# Altium project Main_Board.PrjPcb (part 41 of 44)

## Sheet eMMC.SchDoc: Pamięć nieulotna  eMMC
size A3; Organization: Altium Limited; Address1: L3, 12a Rodborough Rd; Address2: Frenchs Forest; Address3: NSW; Address4: Australia 2086
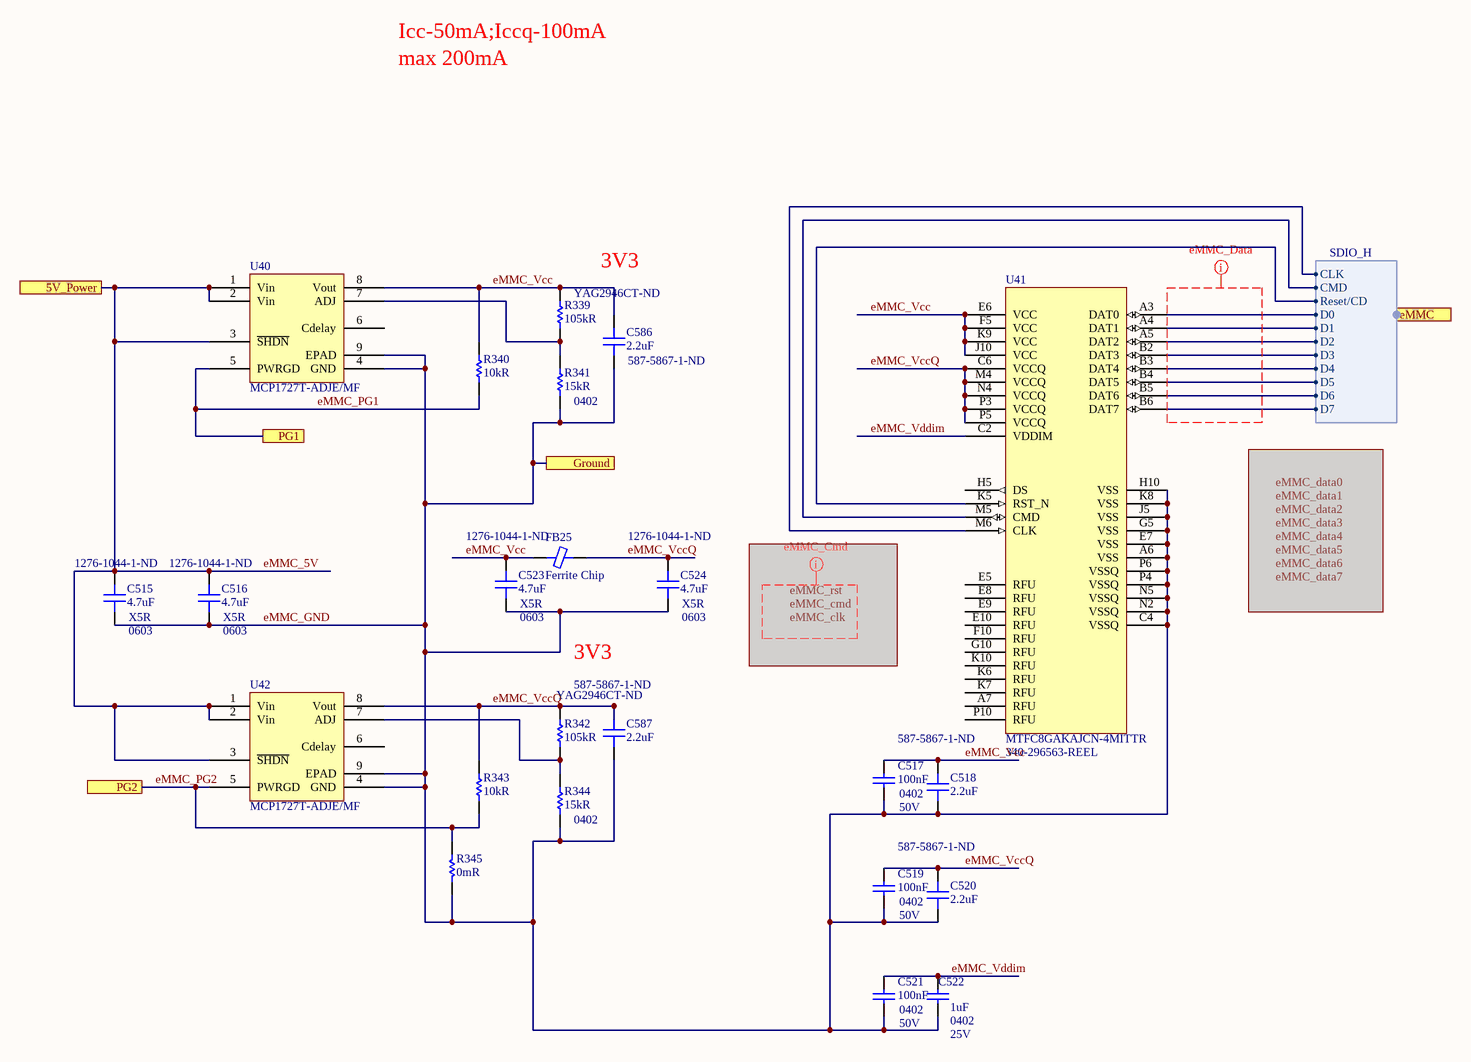
[diagram p66: eMMC.SchDoc]

### Parts
C515  4.7uF  Supplier Part Number 1: 1276-1044-1-ND  Case/Package: 0603  Dielectric: X5R  [CAP 0603/1608 RF]
C516  4.7uF  Supplier Part Number 1: 1276-1044-1-ND  Case/Package: 0603  Dielectric: X5R  [CAP 0603/1608 RF]
C517  100nF  Case Code (Imperial): 0402  Voltage: 50V  [CAP 0402/1005 KK]
C518  2.2uF  Supplier Part Number 1: 587-5867-1-ND  [CAP 0402/1005 KK]
C519  100nF  Case Code (Imperial): 0402  Voltage: 50V  [CAP 0402/1005 KK]
C520  2.2uF  Supplier Part Number 1: 587-5867-1-ND  [CAP 0402/1005 KK]
C521  100nF  Case Code (Imperial): 0402  Voltage: 50V  [CAP 0402/1005 KK]
C522  1uF  Case/Package: 0402  Voltage Rating: 25V  [CAP 0402/1005 KK]
C523  4.7uF  Supplier Part Number 1: 1276-1044-1-ND  Case/Package: 0603  Dielectric: X5R  [CAP 0603/1608 RF]
C524  4.7uF  Supplier Part Number 1: 1276-1044-1-ND  Case/Package: 0603  Dielectric: X5R  [CAP 0603/1608 RF]
C586  2.2uF  Supplier Part Number 1: 587-5867-1-ND  [CAP 0402/1005 KK]
C587  2.2uF  Supplier Part Number 1: 587-5867-1-ND  [CAP 0402/1005 KK]
FB25  Ferrite Chip  [FER 0603/1608]
R339  105kR  Supplier Part Number 1: YAG2946CT-ND  [RES 0402/1005 RF KK]
R340  10kR  [RES 0402/1005 RF KK]
R341  15kR  Case Code (Imperial): 0402  [RES 0402/1005 RF KK]
R342  105kR  Supplier Part Number 1: YAG2946CT-ND  [RES 0402/1005 RF KK]
R343  10kR  [RES 0402/1005 RF KK]
R344  15kR  Case Code (Imperial): 0402  [RES 0402/1005 RF KK]
R345  0mR  [RES 0402/1005 RF KK]
U40  MCP1727T-ADJE/MF  [MCP1727T-ADJE/MF]
U41  MTFC8GAKAJCN-4MITTR  Supplier Part Number 1: 340-296563-REEL  [MTFC8GAKAJCN-4M IT TR]
U42  MCP1727T-ADJE/MF  [MCP1727T-ADJE/MF]

### Ports
5V_Power, eMMC (harness SDIO_H), Ground, PG1, PG2

### Harnesses
SDIO_H: CLK, CMD, Reset/CD, D0, D1, D2, D3, D4, D5, D6, D7

### Nets
eMMC_GND: C515.1 C516.1 C517.1 C518.1 C519.1 C520.1 C521.1 C522.2 C523.1 C524.1 C586.1 C587.1 R341.1 R344.1 R345.2 U40.4(GND) U40.9(EPAD) U41.A6(VSS) U41.C4(VSSQ) U41.E7(VSS) U41.G5(VSS) U41.H10(VSS) U41.J5(VSS) U41.K8(VSS) U41.N2(VSSQ) U41.N5(VSSQ) U41.P4(VSSQ) U41.P6(VSSQ) U42.4(GND) U42.9(EPAD) ; port Ground  [project net B503_Ground]
eMMC_5V: C515.2 C516.2 U40.1(Vin) U40.2(Vin) U40.3(~{SHDN}) U42.1(Vin) U42.2(Vin) U42.3(~{SHDN}) ; port 5V_Power  [project net 5V_RAIL]
eMMC_clk: U41.M6(CLK) ; port eMMC.CLK
eMMC_cmd: U41.M5(CMD) ; port eMMC.CMD
eMMC_data0: U41.A3(DAT0) ; port eMMC.D0
eMMC_data1: U41.A4(DAT1) ; port eMMC.D1
eMMC_data2: U41.A5(DAT2) ; port eMMC.D2
eMMC_data3: U41.B2(DAT3) ; port eMMC.D3
eMMC_data4: U41.B3(DAT4) ; port eMMC.D4
eMMC_data5: U41.B4(DAT5) ; port eMMC.D5
eMMC_data6: U41.B5(DAT6) ; port eMMC.D6
eMMC_data7: U41.B6(DAT7) ; port eMMC.D7
eMMC_PG1: R340.1 U40.5(PWRGD) ; port PG1
eMMC_PG2: R343.1 R345.1 U42.5(PWRGD) ; port PG2
eMMC_rst: U41.K5(RST_N) ; port eMMC.Reset/CD
eMMC_Vcc: C517.2 C518.2 C523.2 C586.2 FB25.1 R339.2 R340.2 U40.8(Vout) U41.E6(VCC) U41.F5(VCC) U41.J10(VCC) U41.K9(VCC)
eMMC_VccQ: C519.2 C520.2 C524.2 C587.2 FB25.2 R342.2 R343.2 U41.C6(VCCQ) U41.M4(VCCQ) U41.N4(VCCQ) U41.P3(VCCQ) U41.P5(VCCQ) U42.8(Vout)
eMMC_Vddim: C521.2 C522.1 U41.C2(VDDIM)
NetR339_1: R339.1 R341.2 U40.7(ADJ)
NetR342_1: R342.1 R344.2 U42.7(ADJ)

Not connected (* = marked no-connect by the designer): U40 6(Cdelay); U41 A7(RFU) E5(RFU) E8(RFU) E9(RFU) E10(RFU) F10(RFU) G10(RFU) H5(DS) K6(RFU) K7(RFU) K10(RFU) P10(RFU); U42 6(Cdelay)

### Layout directives
net class eMMC_Data: (no net found under the mark)
net class eMMC_Cmd: eMMC_clk, eMMC_cmd, eMMC_rst

### Notes on the sheet
- Icc-50mA;Iccq-100mA
- max 200mA
- 3V3
- Title
- Size:
- Date:
- A3
- Number:
- Time:
- Revision:
- Sheet
- of
- File:

### Library data of the parts
C515 C516 C523 C524 = Capacitor: Manufacturer: Samsung; Manufacturer Part Number: CL10A475KP8NNNC; Tolerance: 10%; Voltage Rating: 10V; Supplier 1: Digi-Key; Stock 1: 2124648; Pricing 1: 1 = 0,13000, 10 = 0,09600, 100 = 0,04520, 500 = 0,03168, 1000 = 0,02622 (USD); RoHS: Yes; Mount: Surface Mount; Case Code (Metric): 1608; Case Code (Imperial): 0603; Contact Plating: Tin; Min Operating Temperature: -55°C; Max Operating Temperature: 85°C; Capacitance: 4.7uF; Package Quantity: 1; Packaging: Tape and Reel; Length: 1.6mm; Height: 0.8mm; Width: 0.031inch; Thickness: 0.035inch; Depth: 0.8mm; Radiation Hardening: No; ComponentLink1URL: https://datasheet.ciiva.com/25797/cl10a475kp8nnnc-25797520.pdf?src-supplier=Digi-Key; ComponentLink1Description: https://datasheet.ciiva.com/25797/cl10a475kp8nnnc-25797520.pdf?src-supplier=Digi-Key; ComponentLink2URL: https://datasheet.ciiva.com/26838/getdatasheetpartid-358676-26838384.pdf?src-supplier=Verical; ComponentLink2Description: https://datasheet.ciiva.com/26838/getdatasheetpartid-358676-26838384.pdf?src-supplier=Verical; ComponentLink3URL: https://datasheet.ciiva.com/16318/cl05b104kq5nnnc-16318245.pdf?src-supplier=Future+Electronics; ComponentLink3Description: https://datasheet.ciiva.com/16318/cl05b104kq5nnnc-16318245.pdf?src-supplier=Future+Electronics
C517 C519 C521 = Capacitor: CAP CER 0.1UF 50V X5R 0402; Manufacturer: Murata; Manufacturer Part Number: GRM155R61H104KE14D; Dielectric Material: Ceramic; Dissipation Factor: 0.025%; Tolerance: 10%; Supplier 1: Digi-Key; Supplier Part Number 1: 490-10697-1-ND; RoHS: Yes; Category: Ceramic Capacitors; Stock 1: 435607; Pricing 1: 1=0,10000, 10=0,04600, 100=0,02050, 500=0,01464, 1000=0,01150, 2500=0,01045, 5000=0,00961 (USD); Mount: Surface Mount; Case/Package: 0402; Weight: 0.000212oz; Case Code (Metric): 1005; Min Operating Temperature: -55°C; Max Operating Temperature: 85°C; Capacitance: 100nF; Packaging: Tape and Reel; Voltage Rating: 50V; Dielectric: X5R; Termination: SMD/SMT; Composition: Ceramic; Voltage Rating (DC): 50V; Package Quantity: 10000; Length: 1mm; Height: 0.5mm; Width: 0.02inch; Thickness: 0.022inch; Depth: 0.5mm; REACH SVHC: No SVHC; Lead Free: Lead Free; ComponentLink1URL: http://www.farnell.com/datasheets/2079150.pdf?src-supplier=Farnell; ComponentLink1Description: http://www.farnell.com/datasheets/2079150.pdf?src-supplier=Farnell; ComponentLink2URL: http://www.mouser.com/ds/2/281/c02e-2905.pdf?src-supplier=Mouser; ComponentLink2Description: http://www.mouser.com/ds/2/281/c02e-2905.pdf?src-supplier=Mouser; ComponentLink3URL: http://www.farnell.com/datasheets/2079150.pdf?src-supplier=Element14; ComponentLink3Description: http://www.farnell.com/datasheets/2079150.pdf?src-supplier=Element14; ComponentLink4URL: http://search.murata.co.jp/Ceramy/image/img/A01X/G101/ENG/GRM155R61H104KE14-01.pdf?src-supplier=Digi-Key; ComponentLink4Description: http://search.murata.co.jp/Ceramy/image/img/A01X/G101/ENG/GRM155R61H104KE14-01.pdf?src-supplier=Digi-Key
C518 C520 C586 C587 = Capacitor: CAP CER 2.2UF 6.3V X5R 0402; Manufacturer: Taiyo Yuden; Manufacturer Part Number: JMK105BJ225KV-F; Tolerance: 10%; Supplier 1: Digi-Key; RoHS: Yes; Category: Ceramic Capacitors; Stock 1: 4812; Pricing 1: 1=0,10000, 10=0,06000, 100=0,02650, 500=0,01894, 1000=0,01488, 2500=0,01352, 5000=0,01244 (USD); Mount: Surface Mount; Case/Package: 0402; Case Code (Imperial): 0402; Case Code (Metric): 1005; Min Operating Temperature: -55°C; Max Operating Temperature: 85°C; Packaging: Tape and Reel; Capacitance: 2.2uF; Package Quantity: 10000; Voltage Rating: 6.3V; Voltage Rating (DC): 6.3V; Dielectric: X5R; Termination: SMD/SMT; Composition: Ceramic; Length: 1mm; Height: 0.5mm; Width: 0.5mm; Thickness: 0.022inch; Depth: 0.5mm; Radiation Hardening: No; ComponentLink1URL: https://datasheet.ciiva.com/15921/tmk105b7103kv-15921011.pdf?src-supplier=Onlinecomponents.com; ComponentLink1Description: https://datasheet.ciiva.com/15921/tmk105b7103kv-15921011.pdf?src-supplier=Onlinecomponents.com; ComponentLink2URL: https://datasheet.ciiva.com/30178/cmultilayerceramiccapacitor-30178599.pdf?src-supplier=Onlinecomponents.com; ComponentLink2Description: https://datasheet.ciiva.com/30178/cmultilayerceramiccapacitor-30178599.pdf?src-supplier=Onlinecomponents.com
C522 = Capacitor: MURATA - GRT155R61E105KE01D - SMD Multilayer Ceramic Capacitor, 1 µF, 25 V, 0402 [1005 Metric], ± 10%, X5R, GRT Series - SMD Multilayer Ceramic Capacitor, 1 µF, 25 V, 0402 [1005 Metric], ± 10%, X5R, GRT Series; Supplier 1: Digi-Key; Supplier Part Number 1: 490-12263-1-ND; Manufacturer: Murata; Manufacturer Part Number: GRT155R61E105KE01D; RoHS: Yes; Category: Ceramic Capacitors; Stock 1: 341453; Pricing 1: 1=0,18000, 10=0,12300, 100=0,06210, 500=0,04248, 1000=0,03758, 2500=0,03594, 5000=0,03268 (USD); Mount: Surface Mount; Case Code (Metric): 1005; Case Code (Imperial): 0402; Min Operating Temperature: -55°C; Max Operating Temperature: 85°C; Packaging: Tape and Reel; Capacitance: 1uF; Tolerance: 10%; Dielectric: X5R; Voltage Rating (DC): 25V; Length: 0.039inch; Width: 0.02inch; Thickness: 0.022inch; Ratings: AEC-Q200; ComponentLink1URL: http://www.farnell.com/datasheets/2165918.pdf?src-supplier=Farnell; ComponentLink1Description: http://www.farnell.com/datasheets/2165918.pdf?src-supplier=Farnell; ComponentLink2URL: http://search.murata.co.jp/Ceramy/image/img/A01X/G101/ENG/GRT155R61E105KE01-01.pdf?src-supplier=Digi-Key; ComponentLink2Description: http://search.murata.co.jp/Ceramy/image/img/A01X/G101/ENG/GRT155R61E105KE01-01.pdf?src-supplier=Digi-Key; ComponentLink3URL: http://www.farnell.com/datasheets/2165918.pdf?src-supplier=Element14; ComponentLink3Description: http://www.farnell.com/datasheets/2165918.pdf?src-supplier=Element14
FB25 = Ferrite Chip: SMT Ferrite Chip; Manufacturer: TDK; Manufacturer Part Number: MPZ1608S331ATA00; Tolerance: 25%; Impedance: 330R; DC Resistance (DCR): 80mR; Max DC Current: 1.7A; Supplier 1: Digi-Key; Supplier Part Number 1: 445-5221-1-ND; Stock 1: 117126; Pricing 1: 1 = 0,10000, 10 = 0,07900, 25 = 0,07160, 50 = 0,06440, 100 = 0,04720, 250 = 0,03432, 500 = 0,03146, 1000 = 0,02717 (USD); RoHS: Yes; Mount: Surface Mount; Case/Package: 0603; Case Code (Metric): 1608; Case Code (Imperial): 0603; Core Material: Ferrite; Packaging: Tape and Reel; Package Quantity: 1; Current Rating: 1.7A; Length: 0.063inch; Height: 0.037inch; Width: 0.031inch; REACH SVHC: No SVHC; Lead Free: Lead Free; ComponentLink1URL: https://datasheet.ciiva.com/46634/beads-commercial-power-mpz-en-46634727.pdf?src-supplier=Digi-Key; ComponentLink1Description: https://datasheet.ciiva.com/46634/beads-commercial-power-mpz-en-46634727.pdf?src-supplier=Digi-Key; ComponentLink2URL: https://datasheet.ciiva.com/46634/beads-commercial-power-mpz-en-46634696.pdf?src-supplier=Digi-Key; ComponentLink2Description: https://datasheet.ciiva.com/46634/beads-commercial-power-mpz-en-46634696.pdf?src-supplier=Digi-Key; ComponentLink3URL: https://datasheet.ciiva.com/46634/beads-commercial-power-mpz-en-46634731.pdf?src-supplier=Digi-Key; ComponentLink3Description: https://datasheet.ciiva.com/46634/beads-commercial-power-mpz-en-46634731.pdf?src-supplier=Digi-Key
R339 R342 = Resistor: Thick Film Resistors - SMD 105K OHM 1%; Manufacturer: Yageo; Manufacturer Part Number: RC0402FR-07105KL; Power Rating: 62.5mW; Voltage Rating: 50V; Max Power Dissipation: 63mW; Temperature Coefficient: 100ppm/°C; Supplier 1: Digi-Key; RoHS: Yes; Category: Chip SMD Resistors; Stock 1: 641531; Pricing 1: 1=0,10000, 10=0,01600, 100=0,00640, 1000=0,00289, 2500=0,00251, 5000=0,00207 (USD); Case/Package: 0402; Case Code (Imperial): 0402; Case Code (Metric): 1005; Contact Plating: Tin,Lead,Matte; Min Operating Temperature: -55°C; Max Operating Temperature: 155°C; Tolerance: 1%; Resistance: 105kR; Packaging: Tape and Reel; Composition: Thick Film; Number of Terminations: 2; Termination: SMD/SMT; Military Standard: Not; Features: Moisture Resistant; Length: 1mm; Height: 0.016inch; Width: 0.02inch; Depth: 0.5mm; Radiation Hardening: No; Lead Free: Lead Free; ComponentLink1URL: https://datasheet.ciiva.com/16869/pyu-rc0402-51-rohs-l-6-16869544.pdf?src-supplier=Avnet+Europe; ComponentLink1Description: https://datasheet.ciiva.com/16869/pyu-rc0402-51-rohs-l-6-16869544.pdf?src-supplier=Avnet+Europe; ComponentLink2URL: https://datasheet.ciiva.com/12575/pyu-rc0402-51-rohs-l-6-r-8721-12575887.pdf?src-supplier=Mouser; ComponentLink2Description: https://datasheet.ciiva.com/12575/pyu-rc0402-51-rohs-l-6-r-8721-12575887.pdf?src-supplier=Mouser; ComponentLink3URL: https://datasheet.ciiva.com/8887/pyu-rc0402-51-rohs-l-6-8887815.pdf?src-supplier=Avnet; ComponentLink3Description: https://datasheet.ciiva.com/8887/pyu-rc0402-51-rohs-l-6-8887815.pdf?src-supplier=Avnet; ComponentLink4URL: https://datasheet.ciiva.com/28395/pyu-rc0402-51-rohs-l-6-28395228.pdf?src-supplier=Avnet+Europe; ComponentLink4Description: https://datasheet.ciiva.com/28395/pyu-rc0402-51-rohs-l-6-28395228.pdf?src-supplier=Avnet+Europe
R340 R343 = Resistor: Manufacturer 1: Yageo; Manufacturer Part Number 1: RC0402FR-0710KL; Tolerance: 1%; Temperature Coefficient: 100ppm/°C; Voltage Rating: 50V; Power Rating: 62.5mW; Supplier 1: Digi-Key; Supplier Part Number 1: 311-10.0KLRCT-ND; Stock 1: 71214322; Pricing 1: 1=0,10000, 10=0,01500, 100=0,00600, 1000=0,00270, 2500=0,00235, 5000=0,00194 (USD); RoHS: Yes; Case/Package: 0402; Number of Pins: 2; Case Code (Imperial): 0402; Case Code (Metric): 1005; Min Operating Temperature: -55°C; Max Operating Temperature: 155°C; Resistance: 10kR; Packaging: Tape and Reel; Composition: Thick Film; Voltage Rating (DC): 50V; Termination: SMD/SMT; Military Standard: Not; Working Voltage: 50V; Number of Terminations: 2; Length: 1mm; Height: 0.32mm; Width: 0.5mm; Depth: 0.5mm; Lead Pitch: 0.2mm; REACH SVHC: No SVHC; Lead Free: Lead Free; ComponentLink1URL: https://datasheet.ciiva.com/7660/38568-7660787.pdf?src-supplier=Element14; ComponentLink1Description: https://datasheet.ciiva.com/7660/38568-7660787.pdf?src-supplier=Element14; ComponentLink2URL: https://datasheet.ciiva.com/7849/1784430-7849813.pdf?src-supplier=Element14; ComponentLink2Description: https://datasheet.ciiva.com/7849/1784430-7849813.pdf?src-supplier=Element14; ComponentLink3URL: https://datasheet.ciiva.com/7849/1686128-7849814.pdf?src-supplier=Element14; ComponentLink3Description: https://datasheet.ciiva.com/7849/1686128-7849814.pdf?src-supplier=Element14; ComponentLink4URL: https://datasheet.ciiva.com/7849/1784430-7849815.pdf?src-supplier=Element14; ComponentLink4Description: https://datasheet.ciiva.com/7849/1784430-7849815.pdf?src-supplier=Element14; ComponentLink5URL: https://datasheet.ciiva.com/22747/1018594-22747512.pdf?src-supplier=Element14; ComponentLink5Description: https://datasheet.ciiva.com/22747/1018594-22747512.pdf?src-supplier=Element14; ComponentLink6URL: https://datasheet.ciiva.com/12667/pyu-rc0402-51-rohs-l-6-r-12667067.pdf?src-supplier=Mouser; ComponentLink6Description: https://datasheet.ciiva.com/12667/pyu-rc0402-51-rohs-l-6-r-12667067.pdf?src-supplier=Mouser; ComponentLink7URL: https://datasheet.ciiva.com/7983/1018594-7983486.pdf?src-supplier=Element14; ComponentLink7Description: https://datasheet.ciiva.com/7983/1018594-7983486.pdf?src-supplier=Element14
R341 R344 = Resistor: Manufacturer: Panasonic; Manufacturer Part Number: ERJ-2RKF1502X; Tolerance: 1%; Voltage Rating: 50V; Power Rating: 100mW; Temperature Coefficient: 100ppm/°C; Supplier 1: Digi-Key; Supplier Part Number 1: P15.0KLDKR-ND; Stock 1: 3339464; Pricing 1: 1 = 0,10000, 10 = 0,04100, 100 = 0,01670, 1000 = 0,00751, 2500 = 0,00652, 5000 = 0,00538 (USD); RoHS: Yes; Mount: Surface Mount; Case/Package: 0402; Number of Pins: 2; Weight: 2.8E-05oz; Case Code (Metric): 1005; Contact Plating: Tin; Min Operating Temperature: -55°C; Max Operating Temperature: 155°C; Resistance: 15kR; Packaging: Tape and Reel; Package Quantity: 1; Composition: Thick Film; Termination: SMD/SMT; Number of Terminations: 2; Military Standard: Not; Max Power Dissipation: 100mW; Voltage Rating (DC): 50V; Features: Automotive AEC-Q200; Length: 1mm; Height: 0.35mm; Width: 0.5mm; Depth: 0.5mm; Radiation Hardening: No; REACH SVHC: No SVHC; Lead Free: Lead Free; ComponentLink1URL: https://datasheet.ciiva.com/11821/0900766b80f80784-11821181.pdf?src-supplier=RSComponents; ComponentLink1Description: https://datasheet.ciiva.com/11821/0900766b80f80784-11821181.pdf?src-supplier=RSComponents; ComponentLink2URL: https://datasheet.ciiva.com/16778/70260748-16778682.pdf?src-supplier=Allied+Electronics; ComponentLink2Description: https://datasheet.ciiva.com/16778/70260748-16778682.pdf?src-supplier=Allied+Electronics; ComponentLink3URL: https://datasheet.ciiva.com/46372/1678782-46372862.pdf?src-supplier=Element14; ComponentLink3Description: https://datasheet.ciiva.com/46372/1678782-46372862.pdf?src-supplier=Element14; ComponentLink4URL: https://datasheet.ciiva.com/17211/aoa0000ce2-17211535.pdf?src-supplier=Avnet+Europe; ComponentLink4Description: https://datasheet.ciiva.com/17211/aoa0000ce2-17211535.pdf?src-supplier=Avnet+Europe; ComponentLink5URL: https://datasheet.ciiva.com/46372/1678782-46372863.pdf?src-supplier=Element14; ComponentLink5Description: https://datasheet.ciiva.com/46372/1678782-46372863.pdf?src-supplier=Element14; ComponentLink6URL: https://datasheet.ciiva.com/6138/aoa0000ce2-6138166.pdf?src-supplier=Farnell; ComponentLink6Description: https://datasheet.ciiva.com/6138/aoa0000ce2-6138166.pdf?src-supplier=Farnell; ComponentLink7URL: https://datasheet.ciiva.com/16765/70260748-16765542.pdf?src-supplier=Allied+Electronics; ComponentLink7Description: https://datasheet.ciiva.com/16765/70260748-16765542.pdf?src-supplier=Allied+Electronics; ComponentLink8URL: https://datasheet.ciiva.com/43467/1678782-43467414.pdf?src-supplier=Farnell; ComponentLink8Description: https://datasheet.ciiva.com/43467/1678782-43467414.pdf?src-supplier=Farnell; ComponentLink9URL: https://datasheet.ciiva.com/9193/aoa0000ce2-9193047.pdf?src-supplier=Avnet; ComponentLink9Description: https://datasheet.ciiva.com/9193/aoa0000ce2-9193047.pdf?src-supplier=Avnet; ComponentLink10URL: https://datasheet.ciiva.com/8079/426256-8079609.pdf?src-supplier=Element14; ComponentLink10Description: https://datasheet.ciiva.com/8079/426256-8079609.pdf?src-supplier=Element14; ComponentLink11URL: https://datasheet.ciiva.com/16371/aoa0000ce2-16371499.pdf?src-supplier=Future+Electronics; ComponentLink11Description: https://datasheet.ciiva.com/16371/aoa0000ce2-16371499.pdf?src-supplier=Future+Electronics; ComponentLink12URL: https://datasheet.ciiva.com/22687/1678782-22687068.pdf?src-supplier=Element14; ComponentLink12Description: https://datasheet.ciiva.com/22687/1678782-22687068.pdf?src-supplier=Element14
R345 = Resistor: Manufacturer 1: Yageo; Manufacturer Part Number 1: RC0402JR-070RL; Power Rating: 62.5mW; Tolerance: 5%; Voltage Rating: 50V; Max Power Dissipation: 63mW; Temperature Coefficient: 200ppm/°C; Supplier 1: Digi-Key; Supplier Part Number 1: 311-0.0JRCT-ND; Stock 1: 69822252; Pricing 1: 1=0.10000, 10=0.01200, 25=0.00920, 50=0.00680, 100=0.00510, 250=0.00388, 500=0.00308, 1000=0.00227, 5000=0.00163 (USD); RoHS: Yes; Case/Package: 0402; Contact Plating: Tin,Matte; Case Code (Metric): 1005; Case Code (Imperial): 0402; Min Operating Temperature: -55°C; Max Operating Temperature: 155°C; Resistance: 0mR; Packaging: Tape and Reel; Composition: Thick Film; Package Quantity: 1; Number of Terminations: 2; Termination: SMD/SMT; Military Standard: Not; Features: Moisture Resistant; Length: 1mm; Height: 0.016inch; Width: 0.02inch; Depth: 0.5mm; Radiation Hardening: No; REACH SVHC: Unknown; Lead Free: Lead Free; ComponentLink1URL: https://datasheet.ciiva.com/2452/pyu-rc0402-51-rohs-l-6-2452608.pdf?src-supplier=Digi-Key; ComponentLink1Description: https://datasheet.ciiva.com/2452/pyu-rc0402-51-rohs-l-6-2452608.pdf?src-supplier=Digi-Key; ComponentLink2URL: https://datasheet.ciiva.com/11808/0900766b80c66297-11808195.pdf?src-supplier=RSComponents; ComponentLink2Description: https://datasheet.ciiva.com/11808/0900766b80c66297-11808195.pdf?src-supplier=RSComponents; ComponentLink3URL: https://datasheet.ciiva.com/2452/pyu-r-int-thick-7-2452609.pdf?src-supplier=Digi-Key; ComponentLink3Description: https://datasheet.ciiva.com/2452/pyu-r-int-thick-7-2452609.pdf?src-supplier=Digi-Key; ComponentLink4URL: https://datasheet.ciiva.com/22747/1018594-22747515.pdf?src-supplier=Element14; ComponentLink4Description: https://datasheet.ciiva.com/22747/1018594-22747515.pdf?src-supplier=Element14; ComponentLink5URL: https://datasheet.ciiva.com/7983/1018594-7983535.pdf?src-supplier=Element14; ComponentLink5Description: https://datasheet.ciiva.com/7983/1018594-7983535.pdf?src-supplier=Element14; ComponentLink6URL: https://datasheet.ciiva.com/2452/pyu-r-int-thick-7-2452610.pdf?src-supplier=Digi-Key; ComponentLink6Description: https://datasheet.ciiva.com/2452/pyu-r-int-thick-7-2452610.pdf?src-supplier=Digi-Key; ComponentLink7URL: https://datasheet.ciiva.com/8896/pyu-rc0402-51-rohs-l-6-8896201.pdf?src-supplier=Avnet; ComponentLink7Description: https://datasheet.ciiva.com/8896/pyu-rc0402-51-rohs-l-6-8896201.pdf?src-supplier=Avnet; ComponentLink8URL: https://datasheet.ciiva.com/28386/pyu-rc0402-51-rohs-l-6-28386633.pdf?src-supplier=Avnet+Europe; ComponentLink8Description: https://datasheet.ciiva.com/28386/pyu-rc0402-51-rohs-l-6-28386633.pdf?src-supplier=Avnet+Europe; ComponentLink9URL: https://datasheet.ciiva.com/15189/getdatasheetpartid-326379-15189533.pdf?src-supplier=Verical; ComponentLink9Description: https://datasheet.ciiva.com/15189/getdatasheetpartid-326379-15189533.pdf?src-supplier=Verical
U40 U42 = MCP1727T-ADJE/MF: IC REG LDO ADJ 1.5A 8DFN; Manufacturer 1: Microchip; Number of Outputs: 1; Min Input Voltage: 2.3V; Max Input Voltage: 6V; Output Voltage: 5V; Dropout Voltage: 330mV; Input Bias Current: 120uA; Reference Voltage: 410mV; Polarity: Positive; Accuracy: 0.5%; Output Type: Adjustable; Supplier 1: Digi-Key; Manufacturer Part Number 1: MCP1727T-ADJE/MF; Stock 1: 9419; Pricing 1: 1=0.84000, 25=0.71080, 100=0.63860 (USD); RoHS: Yes; Mount: Surface Mount; Case/Package: DFN; Contact Plating: Tin,Matte; Min Operating Temperature: -40°C; Max Operating Temperature: 125°C; Package Quantity: 3300; Output Current: 1.5A; Packaging: Tape and Reel; Max Output Current: 1.5A; Quiescent Current: 120uA; Radiation Hardening: No; Lead Free: Lead Free; ComponentLink1URL: https://datasheet.ciiva.com/2057/21999b-2057048.pdf?src-supplier=Digi-Key; ComponentLink1Description: https://datasheet.ciiva.com/2057/21999b-2057048.pdf?src-supplier=Digi-Key; ComponentLink2URL: https://datasheet.ciiva.com/8237/jp027822-8237704.pdf?src-supplier=Avnet; ComponentLink2Description: https://datasheet.ciiva.com/8237/jp027822-8237704.pdf?src-supplier=Avnet; ComponentLink3URL: https://datasheet.ciiva.com/17364/jp027822-17364137.pdf?src-supplier=Avnet+Europe; ComponentLink3Description: https://datasheet.ciiva.com/17364/jp027822-17364137.pdf?src-supplier=Avnet+Europe; Supplier Part Number 1: MCP1727T-ADJE/MFCT-ND
U41 = MTFC8GAKAJCN-4MITTR: IC FLASH 64G MMC; Manufacturer 1: Micron Technology; Supplier 1: Mouser; Manufacturer Part Number 1: MTFC8GAKAJCN-4MITTR; Stock 1: 3395; Pricing 1: 1=17,08000, 10=15,72000, 25=15,39000, 50=15,34000, 100=13,76000, 250=13,34000, 500=12,69000, 1000=11,13000, 2000=10,32000 (USD); RoHS: No

## Sheet GTR.SchDoc: GTR
size A3; Organization: Altium Limited; Address1: L3, 12a Rodborough Rd; Address2: Frenchs Forest; Address3: NSW; Address4: Australia 2086
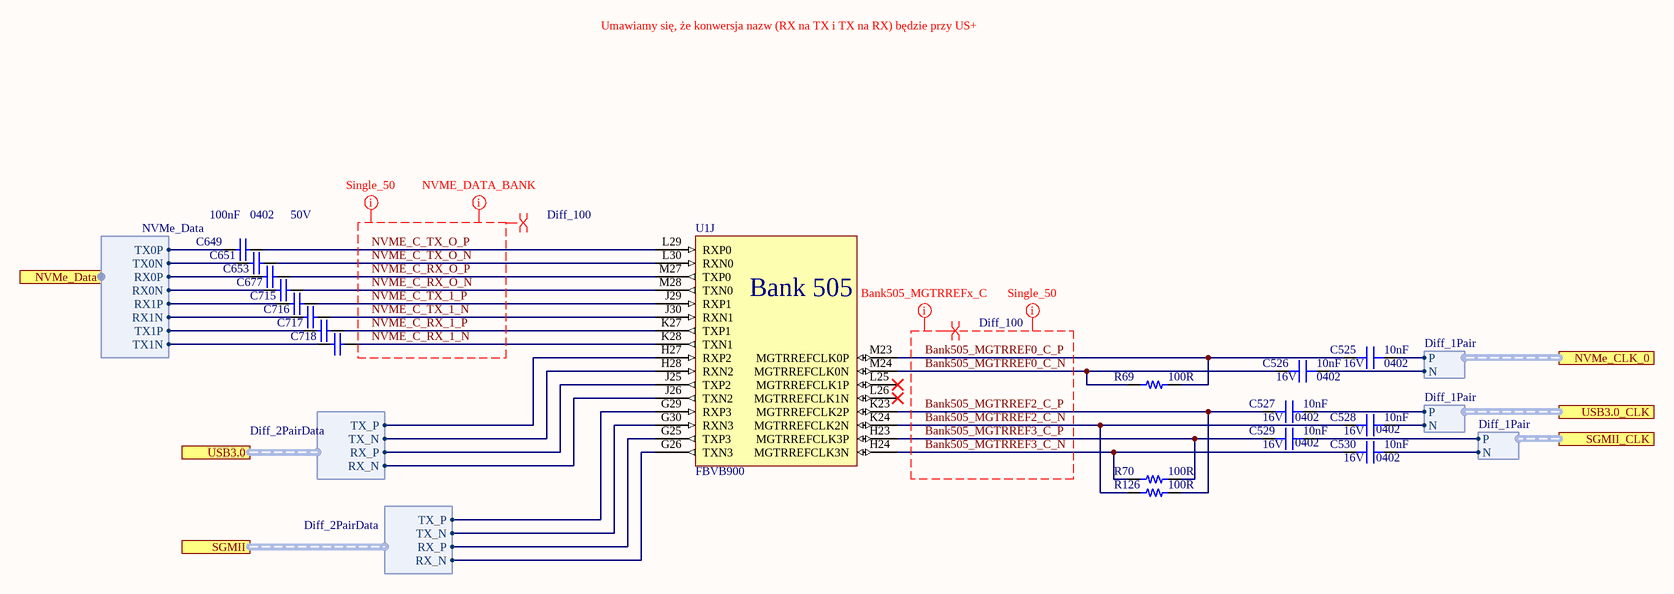
[diagram p67: GTR.SchDoc]

### Parts
C525  10nF  Case/Package: 0402  Voltage Rating (DC): 16V  [CAP 0402/1005 KK]
C526  10nF  Case/Package: 0402  Voltage Rating (DC): 16V  [CAP 0402/1005 KK]
C527  10nF  Case/Package: 0402  Voltage Rating (DC): 16V  [CAP 0402/1005 KK]
C528  10nF  Case/Package: 0402  Voltage Rating (DC): 16V  [CAP 0402/1005 KK]
C529  10nF  Case/Package: 0402  Voltage Rating (DC): 16V  [CAP 0402/1005 KK]
C530  10nF  Case/Package: 0402  Voltage Rating (DC): 16V  [CAP 0402/1005 KK]
C649  100nF  Case Code (Imperial): 0402  Voltage: 50V  [CAP 0402/1005 KK]
C651  100nF  [CAP 0402/1005 KK]  (value not drawn)
C653  100nF  [CAP 0402/1005 KK]  (value not drawn)
C677  100nF  [CAP 0402/1005 KK]  (value not drawn)
C715  100nF  [CAP 0402/1005 KK]  (value not drawn)
C716  100nF  [CAP 0402/1005 KK]  (value not drawn)
C717  100nF  [CAP 0402/1005 KK]  (value not drawn)
C718  100nF  [CAP 0402/1005 KK]  (value not drawn)
R69  100R  [RES 0402/1005 RF KK]
R70  100R  [RES 0402/1005 RF KK]
R126  100R  [RES 0402/1005 RF KK]
U1  FBVB900  [FBVB900 XX]  (part J of 23)

### Ports
NVMe_CLK_0 (harness Diff_1Pair), NVMe_Data (harness NVMe_Data), SGMII (harness Diff_2PairData), SGMII_CLK (harness Diff_1Pair), USB3.0 (harness Diff_2PairData), USB3.0_CLK (harness Diff_1Pair)

### Harnesses
NVMe_Data: RX0P, RX0N, TX0P, TX0N, RX1P, RX1N, TX1P, TX1N
Diff_1Pair: P, N
Diff_2PairData: RX_P, RX_N, TX_P, TX_N

### Nets
Bank505_MGTRREF0_C_N: C526.1 R69.2 U1.M24(MGTRREFCLK0N)
Bank505_MGTRREF0_C_P: C525.1 R69.1 U1.M23(MGTRREFCLK0P)
Bank505_MGTRREF2_C_N: C528.1 R126.2 U1.K24(MGTRREFCLK2N)
Bank505_MGTRREF2_C_P: C527.1 R126.1 U1.K23(MGTRREFCLK2P)
Bank505_MGTRREF3_C_N: C530.1 R70.2 U1.H24(MGTRREFCLK3N)
Bank505_MGTRREF3_C_P: C529.1 R70.1 U1.H23(MGTRREFCLK3P)
LTC6952_0_MATCH_Out7_N: C526.2 ; port NVMe_CLK_0.N
LTC6952_0_MATCH_Out7_P: C525.2 ; port NVMe_CLK_0.P
LTC6952_0_MATCH_Out8_N: C528.2 ; port USB3.0_CLK.N
LTC6952_0_MATCH_Out8_P: C527.2 ; port USB3.0_CLK.P
LTC6952_0_MATCH_Out9_N: C530.2 ; port SGMII_CLK.N
LTC6952_0_MATCH_Out9_P: C529.2 ; port SGMII_CLK.P
NVME_C_RX_1_N: C718.1 U1.K28(TXN1)
NVME_C_RX_1_P: C717.1 U1.K27(TXP1)
NVME_C_RX_O_N: C677.1 U1.M28(TXN0)
NVME_C_RX_O_P: C653.1 U1.M27(TXP0)
NVME_C_TX_1_N: C716.1 U1.J30(RXN1)
NVME_C_TX_1_P: C715.1 U1.J29(RXP1)
NVME_C_TX_O_N: C651.1 U1.L30(RXN0)
NVME_C_TX_O_P: C649.1 U1.L29(RXP0)
NVMe_Rx_0_N: C677.2 ; port NVMe_Data.RX0N
NVMe_Rx_0_P: C653.2 ; port NVMe_Data.RX0P
NVMe_Rx_1_N: C716.2 ; port NVMe_Data.RX1N
NVMe_Rx_1_P: C715.2 ; port NVMe_Data.RX1P
NVMe_Tx_0_N: C651.2 ; port NVMe_Data.TX0N
NVMe_Tx_0_P: C649.2 ; port NVMe_Data.TX0P
NVMe_Tx_1_N: C718.2 ; port NVMe_Data.TX1N
NVMe_Tx_1_P: C717.2 ; port NVMe_Data.TX1P
SGMI_C_Rx_N: U1.G26(TXN3) ; port SGMII.RX_N
SGMI_C_Rx_P: U1.G25(TXP3) ; port SGMII.RX_P
SGMI_C_Tx_N: U1.G29(RXP3) ; port SGMII.TX_P
SGMI_C_Tx_P: U1.G30(RXN3) ; port SGMII.TX_N
USB_RX_N: U1.J25(TXP2) ; port USB3.0.RX_P
USB_RX_P: U1.J26(TXN2) ; port USB3.0.RX_N
USB_TX_N: U1.H28(RXN2) ; port USB3.0.TX_N
USB_TX_P: U1.H27(RXP2) ; port USB3.0.TX_P

Not connected (* = marked no-connect by the designer): U1 L25(MGTRREFCLK1P)* L26(MGTRREFCLK1N)*

### Layout directives
net class Bank505_MGTRREFx_C: Bank505_MGTRREF0_C_N, Bank505_MGTRREF0_C_P, Bank505_MGTRREF2_C_N, Bank505_MGTRREF2_C_P, Bank505_MGTRREF3_C_N, Bank505_MGTRREF3_C_P
net class NVME_DATA_BANK: NVME_C_RX_1_N, NVME_C_RX_1_P, NVME_C_RX_O_N, NVME_C_RX_O_P, NVME_C_TX_1_N, NVME_C_TX_1_P, NVME_C_TX_O_N, NVME_C_TX_O_P
net class Single_50: Bank505_MGTRREF0_C_N, Bank505_MGTRREF0_C_P, Bank505_MGTRREF2_C_N, Bank505_MGTRREF2_C_P, Bank505_MGTRREF3_C_N, Bank505_MGTRREF3_C_P, NVME_C_RX_1_N, NVME_C_RX_1_P, NVME_C_RX_O_N, NVME_C_RX_O_P, NVME_C_TX_1_N, NVME_C_TX_1_P, NVME_C_TX_O_N, NVME_C_TX_O_P
differential pair; differential pair class Diff_100: Bank505_MGTRREF0_C_N, Bank505_MGTRREF0_C_P, Bank505_MGTRREF2_C_N, Bank505_MGTRREF2_C_P, Bank505_MGTRREF3_C_N, Bank505_MGTRREF3_C_P, NVME_C_RX_1_N, NVME_C_RX_1_P, NVME_C_RX_O_N, NVME_C_RX_O_P, NVME_C_TX_1_N, NVME_C_TX_1_P, NVME_C_TX_O_N, NVME_C_TX_O_P

### Notes on the sheet
- Umawiamy się, że konwersja nazw (RX na TX i TX na RX) będzie przy US+
- Title
- Size:
- Date:
- A3
- Number:
- Time:
- Revision:
- Sheet
- of
- File:
- (in symbol FBVB900, part J) Bank 505

### Library data of the parts
C525-C530 = Capacitor: Manufacturer: KEMET; Manufacturer Part Number: C0402C103K4RACTU; Dielectric Material: Ceramic; Tolerance: 10%; Dielectric: X7R; Dissipation Factor: 3.5%; Supplier 1: Digi-Key; Supplier Part Number 1: 399-1038-1-ND; Stock 1: 1112674; Pricing 1: 1 = 0,10000, 10 = 0,02800, 100 = 0,01240, 500 = 0,00886, 1000 = 0,00696, 2500 = 0,00632, 5000 = 0,00582 (USD); RoHS: Yes; Mount: Surface Mount,PCB; Number of Pins: 2; Case Code (Metric): 1005; Case Code (Imperial): 0402; Contact Plating: Tin,Matte; Min Operating Temperature: -55°C; Max Operating Temperature: 125°C; Capacitance: 10nF; Packaging: Tape and Reel; Package Quantity: 1; Voltage Rating: 16V; Termination: SMD/SMT; Voltage: 16V; Length: 1mm; Height: 0.5mm; Width: 0.02inch; Depth: 0.5mm; Thickness: 0.022inch; Lead Pitch: 0.3mm; Radiation Hardening: No; REACH SVHC: No SVHC; ComponentLink1URL: https://datasheet.ciiva.com/14595/70095383-14595321.pdf?src-supplier=Allied+Electronics; ComponentLink1Description: https://datasheet.ciiva.com/14595/70095383-14595321.pdf?src-supplier=Allied+Electronics; ComponentLink2URL: https://datasheet.ciiva.com/7747/kem-c1002-x7r-smd-7747614.pdf?src-supplier=Element14; ComponentLink2Description: https://datasheet.ciiva.com/7747/kem-c1002-x7r-smd-7747614.pdf?src-supplier=Element14
C649 C651 C653 C677 C715-C718 = Capacitor: as C517 on sheet eMMC; Supplier 1: Digi-Key; Supplier Part Number 1: 490-10697-1-ND; RoHS: Yes; Category: Ceramic Capacitors; Stock 1: 435607; Pricing 1: 1=0,10000, 10=0,04600, 100=0,02050, 500=0,01464, 1000=0,01150, 2500=0,01045, 5000=0,00961 (USD); Mount: Surface Mount; Case/Package: 0402; Weight: 0.000212oz; Case Code (Metric): 1005; Min Operating Temperature: -55°C; Max Operating Temperature: 85°C; Capacitance: 100nF; Packaging: Tape and Reel; Voltage Rating: 50V; Dielectric: X5R; Termination: SMD/SMT; Composition: Ceramic; Voltage Rating (DC): 50V; Package Quantity: 10000; Length: 1mm; Height: 0.5mm; Width: 0.02inch; Thickness: 0.022inch; Depth: 0.5mm; REACH SVHC: No SVHC; Lead Free: Lead Free; ComponentLink1URL: http://www.farnell.com/datasheets/2079150.pdf?src-supplier=Farnell; ComponentLink1Description: http://www.farnell.com/datasheets/2079150.pdf?src-supplier=Farnell; ComponentLink2URL: http://www.mouser.com/ds/2/281/c02e-2905.pdf?src-supplier=Mouser; ComponentLink2Description: http://www.mouser.com/ds/2/281/c02e-2905.pdf?src-supplier=Mouser; ComponentLink3URL: http://www.farnell.com/datasheets/2079150.pdf?src-supplier=Element14; ComponentLink3Description: http://www.farnell.com/datasheets/2079150.pdf?src-supplier=Element14; ComponentLink4URL: http://search.murata.co.jp/Ceramy/image/img/A01X/G101/ENG/GRM155R61H104KE14-01.pdf?src-supplier=Digi-Key; ComponentLink4Description: http://search.murata.co.jp/Ceramy/image/img/A01X/G101/ENG/GRM155R61H104KE14-01.pdf?src-supplier=Digi-Key
  C651 C653 C677 C715-C718: Case Code (Imperial): 0402; Voltage: 50V
R69 R70 R126 = Resistor: Manufacturer: Vishay Dale; Manufacturer Part Number: CRCW0402100RFKED; Tolerance: 1%; Power Rating: 63mW; Voltage Rating: 50V; Temperature Coefficient: 100ppm/°C; Supplier 1: Digi-Key; Supplier Part Number 1: 541-100LDKR-ND; Stock 1: 93648; Pricing 1: 1 = 0,10000, 10 = 0,03600, 100 = 0,01460, 1000 = 0,00657, 2500 = 0,00570, 5000 = 0,00471 (USD); RoHS: Yes; Mount: Surface Mount; Case/Package: 0402; Weight: 2.3E-05oz; Case Code (Metric): 1005; Case Code (Imperial): 0402; Contact Plating: Tin; Min Operating Temperature: -55°C; Max Operating Temperature: 155°C; Resistance: 100R; Packaging: Tape and Reel; Composition: Thick Film; Termination: SMD/SMT; Package Quantity: 10; Number of Terminations: 2; Military Standard: Not; Max Power Dissipation: 63mW; Voltage Rating (DC): 50V; Features: Automotive AEC-Q200; Working Voltage: 50V; Length: 1mm; Height: 0.35mm; Width: 0.02inch; Depth: 0.5mm; Radiation Hardening: No; REACH SVHC: Unknown; Lead Free: Lead Free; ComponentLink1URL: https://datasheet.ciiva.com/11809/0900766b80d98824-11809081.pdf?src-supplier=RSComponents; ComponentLink1Description: https://datasheet.ciiva.com/11809/0900766b80d98824-11809081.pdf?src-supplier=RSComponents; ComponentLink2URL: https://datasheet.ciiva.com/2463/dcrcwe3-2463094.pdf?src-supplier=Digi-Key; ComponentLink2Description: https://datasheet.ciiva.com/2463/dcrcwe3-2463094.pdf?src-supplier=Digi-Key; ComponentLink3URL: https://datasheet.ciiva.com/16199/dcrcwe3-16199158.pdf?src-supplier=Future+Electronics; ComponentLink3Description: https://datasheet.ciiva.com/16199/dcrcwe3-16199158.pdf?src-supplier=Future+Electronics; ComponentLink4URL: https://datasheet.ciiva.com/2463/dcrcwe3-2463095.pdf?src-supplier=Digi-Key; ComponentLink4Description: https://datasheet.ciiva.com/2463/dcrcwe3-2463095.pdf?src-supplier=Digi-Key; ComponentLink5URL: https://datasheet.ciiva.com/2463/dcrcwe3-2463096.pdf?src-supplier=Digi-Key; ComponentLink5Description: https://datasheet.ciiva.com/2463/dcrcwe3-2463096.pdf?src-supplier=Digi-Key; ComponentLink6URL: https://datasheet.ciiva.com/5552/dcrcwe3-109170-5552168.pdf?src-supplier=Mouser; ComponentLink6Description: https://datasheet.ciiva.com/5552/dcrcwe3-109170-5552168.pdf?src-supplier=Mouser; ComponentLink7URL: https://datasheet.ciiva.com/8083/dcrcwe3-8083977.pdf?src-supplier=Avnet; ComponentLink7Description: https://datasheet.ciiva.com/8083/dcrcwe3-8083977.pdf?src-supplier=Avnet; ComponentLink8URL: https://datasheet.ciiva.com/16722/70201119-16722524.pdf?src-supplier=Allied+Electronics; ComponentLink8Description: https://datasheet.ciiva.com/16722/70201119-16722524.pdf?src-supplier=Allied+Electronics; ComponentLink9URL: https://datasheet.ciiva.com/22673/1697337-22673117.pdf?src-supplier=Element14; ComponentLink9Description: https://datasheet.ciiva.com/22673/1697337-22673117.pdf?src-supplier=Element14; ComponentLink10URL: https://datasheet.ciiva.com/22673/1697337-22673118.pdf?src-supplier=Element14; ComponentLink10Description: https://datasheet.ciiva.com/22673/1697337-22673118.pdf?src-supplier=Element14; ComponentLink11URL: https://datasheet.ciiva.com/3255/dcrcwe3-3255951.pdf?src-supplier=Avnet; ComponentLink11Description: https://datasheet.ciiva.com/3255/dcrcwe3-3255951.pdf?src-supplier=Avnet
U1 = FBVB900: FPGA Zynq UltraScale+ Family 192150 Cells 20nm Technology 0.85V 900-Pin FCBGA Tray; Manufacturer Part Number: XCZU4CG-1FBVB900E; Manufacturer: Xilinx; Peripherals: WDT,DMA; Interface: I2C,SPI,USB,Ethernet,MMC,SDIO,SD,UART,USART,EBI/EMI; Core Architecture: ARM; RAM Size: 256KB; Frequency: 500MHz; Number of I/Os: 204; Supplier 1: Mouser; Supplier Part Number 1: 217-CZU4CG-1FBVB900E; Stock 1: 3; Pricing 1: 1=0,00000, 5=1060,70000 (USD); RoHS: No; Case/Package: FCBGA; Min Operating Temperature: 0°C; Max Operating Temperature: 100°C; Packaging: Tray; ComponentLink1URL: https://www.xilinx.com/support/documentation/data_sheets/ds891-zynq-ultrascale-plus-overview.pdf?src-supplier=Digi-Key; ComponentLink1Description: https://www.xilinx.com/support/documentation/data_sheets/ds891-zynq-ultrascale-plus-overview.pdf?src-supplier=Digi-Key; ComponentLink2URL: https://www.xilinx.com/support/documentation/data_sheets/ds925-zynq-ultrascale-plus.pdf?src-supplier=Digi-Key; ComponentLink2Description: https://www.xilinx.com/support/documentation/data_sheets/ds925-zynq-ultrascale-plus.pdf?src-supplier=Digi-Key; Supplier 2: Avnet; Supplier 3: Digi-Key; Supplier Part Number 2: XCZU4CG-1FBVB900E; Supplier Part Number 3: XCZU4CG-1FBVB900E-ND

## Sheet Expander_RESET.SchDoc
size A3
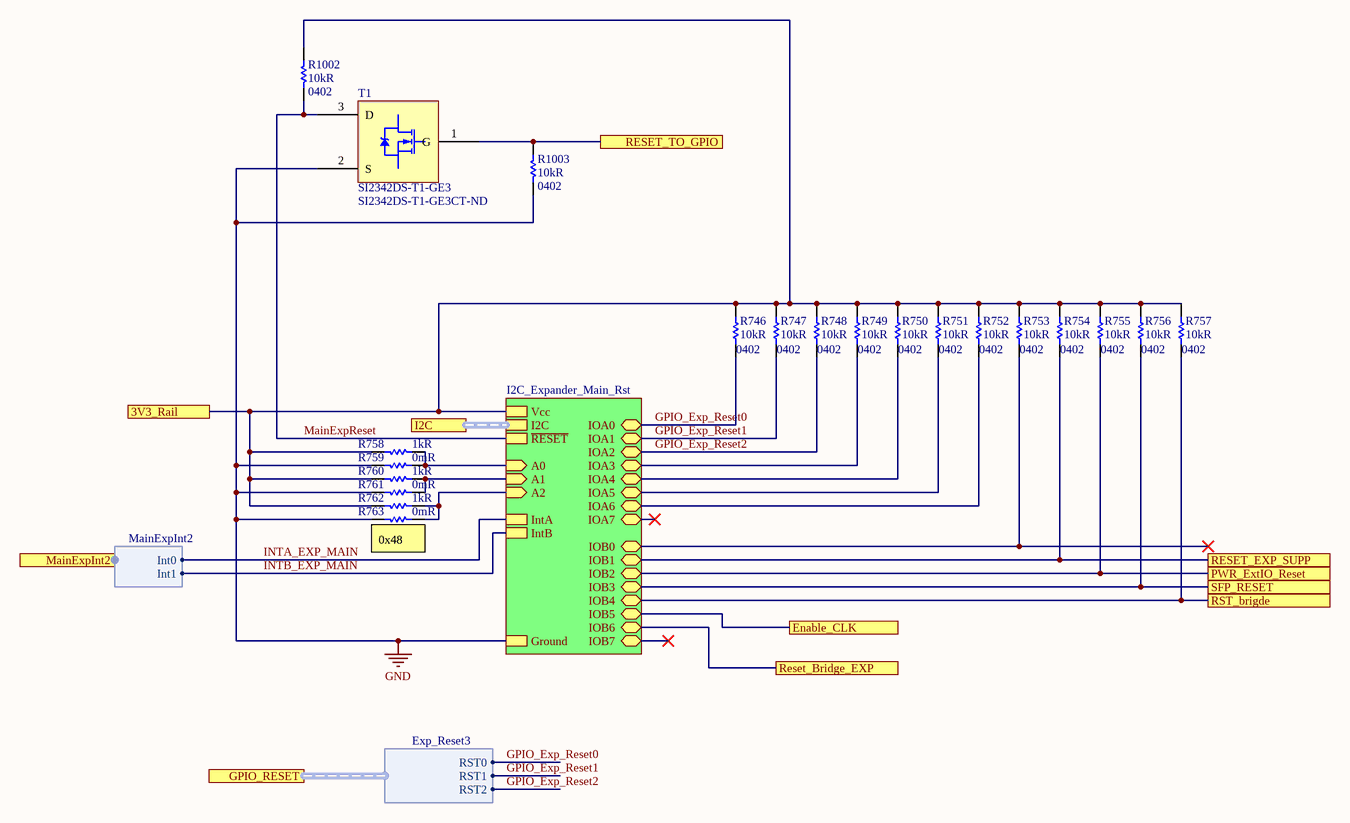
[diagram p68: Expander_RESET.SchDoc]

### Parts
R746  10kR  Case Code (Imperial): 0402  [RES 0402/1005 RF KK]
R747  10kR  Case Code (Imperial): 0402  [RES 0402/1005 RF KK]
R748  10kR  Case Code (Imperial): 0402  [RES 0402/1005 RF KK]
R749  10kR  Case Code (Imperial): 0402  [RES 0402/1005 RF KK]
R750  10kR  Case Code (Imperial): 0402  [RES 0402/1005 RF KK]
R751  10kR  Case Code (Imperial): 0402  [RES 0402/1005 RF KK]
R752  10kR  Case Code (Imperial): 0402  [RES 0402/1005 RF KK]
R753  10kR  Case Code (Imperial): 0402  [RES 0402/1005 RF KK]
R754  10kR  Case Code (Imperial): 0402  [RES 0402/1005 RF KK]
R755  10kR  Case Code (Imperial): 0402  [RES 0402/1005 RF KK]
R756  10kR  Case Code (Imperial): 0402  [RES 0402/1005 RF KK]
R757  10kR  Case Code (Imperial): 0402  [RES 0402/1005 RF KK]
R758  1kR  [RES 0402/1005 RF KK]
R759  0mR  [RES 0402/1005 RF KK]
R760  1kR  [RES 0402/1005 RF KK]
R761  0mR  [RES 0402/1005 RF KK]
R762  1kR  [RES 0402/1005 RF KK]
R763  0mR  [RES 0402/1005 RF KK]
R1002  10kR  Case Code (Imperial): 0402  [RES 0402/1005 RF KK]
R1003  10kR  Case Code (Imperial): 0402  [RES 0402/1005 RF KK]
T1  SI2342DS-T1-GE3  Supplier Part Number 1: SI2342DS-T1-GE3CT-ND  [SI2342DS-T1-GE3]

### Sub-sheets
I2C_Expander_Main_Rst = I2C_Expander.SchDoc: IOA7 (bidir), IOA3 (bidir), IOA6 (bidir), IOA1 (bidir), IOA0 (bidir), IOA5 (bidir), IOB1 (bidir), IOB2 (bidir), IOB5 (bidir), IOB6 (bidir), IOB7 (bidir), IntA, IntB, Ground, IOB4 (bidir), IOB3 (bidir), IOA2 (bidir), IOA4 (bidir), IOB0 (bidir), Vcc, ~{RESET}, I2C (harness I2C), A2 (in), A1 (in), A0 (in)

### Ports
3V3_Rail, Enable_CLK, GPIO_RESET (harness Exp_Reset3), I2C (harness I2C), MainExpInt2 (harness MainExpInt2), PWR_ExtIO_Reset, Reset_Bridge_EXP, RESET_EXP_SUPP, RESET_TO_GPIO, RST_brigde, SFP_RESET

### Harnesses
Exp_Reset3: RST0, RST1, RST2
MainExpInt2: Int0, Int1

### Nets
GND: R759.2 R761.2 R763.2 R1003.1 T1.2(S) ; sheet I2C_Expander_Main_Rst/Ground  [project net B503_Ground]
3V3_RAIL: R746.2 R747.2 R748.2 R749.2 R750.2 R751.2 R752.2 R753.2 R754.2 R755.2 R756.2 R757.2 R758.1 R760.1 R762.1 R1002.2 ; port 3V3_Rail, sheet I2C_Expander_Main_Rst/Vcc
Enable_CLK: port Enable_CLK, sheet I2C_Expander_Main_Rst/IOB5
EXPANDER_RESET: R1003.2 T1.1(G) ; port RESET_TO_GPIO
GPIO_Exp_Reset0: R746.1 ; sheet I2C_Expander_Main_Rst/IOA0, port GPIO_RESET.RST0
GPIO_Exp_Reset1: R747.1 ; sheet I2C_Expander_Main_Rst/IOA1, port GPIO_RESET.RST1
GPIO_Exp_Reset2: R748.1 ; sheet I2C_Expander_Main_Rst/IOA2, port GPIO_RESET.RST2
INTA_EXP_MAIN: sheet I2C_Expander_Main_Rst/IntA, port MainExpInt2.Int0
INTB_EXP_MAIN: sheet I2C_Expander_Main_Rst/IntB, port MainExpInt2.Int1
MainExpReset: R1002.1 T1.3(D) ; sheet I2C_Expander_Main_Rst/~{RESET}
PWR_ExtIO_nReset: R755.1 ; port PWR_ExtIO_Reset, sheet I2C_Expander_Main_Rst/IOB2
RST_brigde: R757.1 ; port RST_brigde, sheet I2C_Expander_Main_Rst/IOB4
SFP_IO_nReset: R756.1 ; port SFP_RESET, sheet I2C_Expander_Main_Rst/IOB3
NetR749_1: R749.1 ; sheet I2C_Expander_Main_Rst/IOA3
NetR750_1: R750.1 ; sheet I2C_Expander_Main_Rst/IOA4
NetR751_1: R751.1 ; sheet I2C_Expander_Main_Rst/IOA5
NetR752_1: R752.1 ; sheet I2C_Expander_Main_Rst/IOA6
NetR753_1: R753.1 ; sheet I2C_Expander_Main_Rst/IOB0
NetR754_1: R754.1 ; port RESET_EXP_SUPP, sheet I2C_Expander_Main_Rst/IOB1
NetR758_2: R758.2 R759.1 ; sheet I2C_Expander_Main_Rst/A0
NetR760_2: R760.2 R761.1 ; sheet I2C_Expander_Main_Rst/A1
NetR762_2: R762.2 R763.1 ; sheet I2C_Expander_Main_Rst/A2
NetSP12_I2C_Bridge_GPIO_1: port Reset_Bridge_EXP, sheet I2C_Expander_Main_Rst/IOB6

### Buses and harness runs
harness port I2C = sheet I2C_Expander_Main_Rst/I2C

### Notes on the sheet
- (near R763) 0x48
- Title
- Size:
- Date:
- A3
- Number:
- Time:
- Revision:
- Sheet
- of
- File:

### Library data of the parts
R746-R757 R1002 R1003 = Resistor: Surface Mount Thick Film Resistor, Rc Series, 10 Kohm, 62.5 Mw, - 1%, 50 V, 0402 [1005 Metric]; Manufacturer: Yageo; Manufacturer Part Number: RC0402FR-0710KL; Voltage Rating: 50V; Power Rating: 62.5mW; Temperature Coefficient: 100ppm/°C; Supplier 1: Digi-Key; Supplier Part Number 1: 311-10.0KLRDKR-ND; RoHS: Yes; Category: Chip SMD Resistors; Stock 1: 50506721; Pricing 1: 1=0,10000, 10=0,01600, 100=0,00640, 1000=0,00289, 2500=0,00251, 5000=0,00207 (USD); Case/Package: 0402; Number of Pins: 2; Case Code (Metric): 1005; Min Operating Temperature: -55°C; Max Operating Temperature: 155°C; Resistance: 10kR; Tolerance: 1%; Packaging: Tape and Reel; Termination: SMD/SMT; Composition: Thick Film; Military Standard: Not; Voltage Rating (DC): 50V; Working Voltage: 50V; Number of Terminations: 2; Length: 1mm; Height: 0.32mm; Width: 0.5mm; Depth: 0.5mm; Lead Pitch: 0.2mm; REACH SVHC: No SVHC; Lead Free: Lead Free; ComponentLink1URL: https://datasheet.ciiva.com/7660/38568-7660787.pdf?src-supplier=Element14; ComponentLink1Description: https://datasheet.ciiva.com/7660/38568-7660787.pdf?src-supplier=Element14; ComponentLink2URL: https://datasheet.ciiva.com/7849/1784430-7849813.pdf?src-supplier=Element14; ComponentLink2Description: https://datasheet.ciiva.com/7849/1784430-7849813.pdf?src-supplier=Element14; ComponentLink3URL: https://datasheet.ciiva.com/7849/1686128-7849814.pdf?src-supplier=Element14; ComponentLink3Description: https://datasheet.ciiva.com/7849/1686128-7849814.pdf?src-supplier=Element14; ComponentLink4URL: https://datasheet.ciiva.com/7849/1784430-7849815.pdf?src-supplier=Element14; ComponentLink4Description: https://datasheet.ciiva.com/7849/1784430-7849815.pdf?src-supplier=Element14; ComponentLink5URL: https://datasheet.ciiva.com/22747/1018594-22747512.pdf?src-supplier=Element14; ComponentLink5Description: https://datasheet.ciiva.com/22747/1018594-22747512.pdf?src-supplier=Element14; ComponentLink6URL: https://datasheet.ciiva.com/12667/pyu-rc0402-51-rohs-l-6-r-12667067.pdf?src-supplier=Mouser; ComponentLink6Description: https://datasheet.ciiva.com/12667/pyu-rc0402-51-rohs-l-6-r-12667067.pdf?src-supplier=Mouser; ComponentLink7URL: https://datasheet.ciiva.com/7983/1018594-7983486.pdf?src-supplier=Element14; ComponentLink7Description: https://datasheet.ciiva.com/7983/1018594-7983486.pdf?src-supplier=Element14
R758 R760 R762 = Resistor: PANASONIC - ERJ-2RKF1001X - SMD Chip Resistor, 0402 [1005 Metric], 1 kohm, ERJ2R Series, 50 V, Thick Film, 100 mW; Temperature Coefficient: 100ppm/°C; Tolerance: 1%; Voltage Rating (DC): 50V; Power Rating: 100mW; Supplier 1: Digi-Key; Supplier Part Number 1: P1.00KLDKR-ND; Manufacturer: Panasonic; Manufacturer Part Number: ERJ-2RKF1001X; RoHS: Yes; Category: Chip SMD Resistors; Stock 1: 1864188; Pricing 1: 1=0,10000, 10=0,04300, 100=0,01740, 1000=0,00782, 2500=0,00678, 5000=0,00561 (USD); Mount: Surface Mount; Case/Package: 0402; Number of Pins: 2; Contact Plating: Tin; Case Code (Imperial): 0402; Case Code (Metric): 1005; Min Operating Temperature: -55°C; Max Operating Temperature: 155°C; Composition: Thick Film; Resistance: 1kR; Termination: SMD/SMT; Number of Terminations: 2; Military Standard: Not; Features: Automotive AEC-Q200; Packaging: Tape and Reel; Voltage Rating: 50V; Package Quantity: 1; Max Power Dissipation: 100mW; Working Voltage: 50V; Length: 1mm; Height: 0.35mm; Depth: 0.5mm; Width: 0.5mm; Radiation Hardening: No; Lead Free: Lead Free; REACH SVHC: No SVHC; ComponentLink1URL: https://datasheet.ciiva.com/11821/0900766b80f80784-11821203.pdf?src-supplier=RSComponents; ComponentLink1Description: https://datasheet.ciiva.com/11821/0900766b80f80784-11821203.pdf?src-supplier=RSComponents; ComponentLink2URL: https://datasheet.ciiva.com/7942/aoa0000ce2-7942426.pdf?src-supplier=Element14; ComponentLink2Description: https://datasheet.ciiva.com/7942/aoa0000ce2-7942426.pdf?src-supplier=Element14; ComponentLink3URL: https://datasheet.ciiva.com/16523/aoa0000ce2-16523834.pdf?src-supplier=Avnet+Asia; ComponentLink3Description: https://datasheet.ciiva.com/16523/aoa0000ce2-16523834.pdf?src-supplier=Avnet+Asia; ComponentLink4URL: https://datasheet.ciiva.com/17215/aoa0000ce2-17215308.pdf?src-supplier=Avnet+Europe; ComponentLink4Description: https://datasheet.ciiva.com/17215/aoa0000ce2-17215308.pdf?src-supplier=Avnet+Europe; ComponentLink5URL: https://datasheet.ciiva.com/22673/1678782-22673916.pdf?src-supplier=Element14; ComponentLink5Description: https://datasheet.ciiva.com/22673/1678782-22673916.pdf?src-supplier=Element14; ComponentLink6URL: https://datasheet.ciiva.com/28532/1678782-28532109.pdf?src-supplier=Element14; ComponentLink6Description: https://datasheet.ciiva.com/28532/1678782-28532109.pdf?src-supplier=Element14; ComponentLink7URL: https://datasheet.ciiva.com/16767/70260748-16767559.pdf?src-supplier=Allied+Electronics; ComponentLink7Description: https://datasheet.ciiva.com/16767/70260748-16767559.pdf?src-supplier=Allied+Electronics; ComponentLink8URL: https://datasheet.ciiva.com/9198/aoa0000ce2-9198920.pdf?src-supplier=Avnet; ComponentLink8Description: https://datasheet.ciiva.com/9198/aoa0000ce2-9198920.pdf?src-supplier=Avnet; ComponentLink9URL: https://datasheet.ciiva.com/16771/70260748-16771979.pdf?src-supplier=Allied+Electronics; ComponentLink9Description: https://datasheet.ciiva.com/16771/70260748-16771979.pdf?src-supplier=Allied+Electronics
R759 R761 R763 = Resistor: as R345 on sheet eMMC; Supplier 1: Digi-Key; Supplier Part Number 1: 311-0.0JRCT-ND; Stock 1: 69822252; Pricing 1: 1=0.10000, 10=0.01200, 25=0.00920, 50=0.00680, 100=0.00510, 250=0.00388, 500=0.00308, 1000=0.00227, 5000=0.00163 (USD); RoHS: Yes; Case/Package: 0402; Contact Plating: Tin,Matte; Case Code (Metric): 1005; Case Code (Imperial): 0402; Min Operating Temperature: -55°C; Max Operating Temperature: 155°C; Resistance: 0mR; Packaging: Tape and Reel; Composition: Thick Film; Package Quantity: 1; Number of Terminations: 2; Termination: SMD/SMT; Military Standard: Not; Features: Moisture Resistant; Length: 1mm; Height: 0.016inch; Width: 0.02inch; Depth: 0.5mm; Radiation Hardening: No; REACH SVHC: Unknown; Lead Free: Lead Free; ComponentLink1URL: https://datasheet.ciiva.com/2452/pyu-rc0402-51-rohs-l-6-2452608.pdf?src-supplier=Digi-Key; ComponentLink1Description: https://datasheet.ciiva.com/2452/pyu-rc0402-51-rohs-l-6-2452608.pdf?src-supplier=Digi-Key; ComponentLink2URL: https://datasheet.ciiva.com/11808/0900766b80c66297-11808195.pdf?src-supplier=RSComponents; ComponentLink2Description: https://datasheet.ciiva.com/11808/0900766b80c66297-11808195.pdf?src-supplier=RSComponents; ComponentLink3URL: https://datasheet.ciiva.com/2452/pyu-r-int-thick-7-2452609.pdf?src-supplier=Digi-Key; ComponentLink3Description: https://datasheet.ciiva.com/2452/pyu-r-int-thick-7-2452609.pdf?src-supplier=Digi-Key; ComponentLink4URL: https://datasheet.ciiva.com/22747/1018594-22747515.pdf?src-supplier=Element14; ComponentLink4Description: https://datasheet.ciiva.com/22747/1018594-22747515.pdf?src-supplier=Element14; ComponentLink5URL: https://datasheet.ciiva.com/7983/1018594-7983535.pdf?src-supplier=Element14; ComponentLink5Description: https://datasheet.ciiva.com/7983/1018594-7983535.pdf?src-supplier=Element14; ComponentLink6URL: https://datasheet.ciiva.com/2452/pyu-r-int-thick-7-2452610.pdf?src-supplier=Digi-Key; ComponentLink6Description: https://datasheet.ciiva.com/2452/pyu-r-int-thick-7-2452610.pdf?src-supplier=Digi-Key; ComponentLink7URL: https://datasheet.ciiva.com/8896/pyu-rc0402-51-rohs-l-6-8896201.pdf?src-supplier=Avnet; ComponentLink7Description: https://datasheet.ciiva.com/8896/pyu-rc0402-51-rohs-l-6-8896201.pdf?src-supplier=Avnet; ComponentLink8URL: https://datasheet.ciiva.com/28386/pyu-rc0402-51-rohs-l-6-28386633.pdf?src-supplier=Avnet+Europe; ComponentLink8Description: https://datasheet.ciiva.com/28386/pyu-rc0402-51-rohs-l-6-28386633.pdf?src-supplier=Avnet+Europe; ComponentLink9URL: https://datasheet.ciiva.com/15189/getdatasheetpartid-326379-15189533.pdf?src-supplier=Verical; ComponentLink9Description: https://datasheet.ciiva.com/15189/getdatasheetpartid-326379-15189533.pdf?src-supplier=Verical
T1 = SI2342DS-T1-GE3: Trans MOSFET N-CH 8V 6A 3-Pin SOT-23 T/R; Manufacturer: Vishay; Rds On Max: 17mR; Input Capacitance: 1.07nF; Rise Time: 14ns; Max Power Dissipation: 2.5W; Number of Elements: 1; Power Dissipation: 1.3W; Turn-On Delay Time: 6ns; Turn-Off Delay Time: 65ns; Fall Time: 25ns; Threshold Voltage: 800mV; Gate to Source Voltage (Vgs): 5V; Supplier 1: Digi-Key; Manufacturer Part Number: SI2342DS-T1-GE3; RoHS: Yes; Category: MOSFETs; Stock 1: 25972; Pricing 1: 1=0,50000, 10=0,42500, 25=0,39640, 100=0,29460, 250=0,27984, 500=0,23000, 1000=0,18695 (USD); Mount: Surface Mount; Case/Package: SOT-23; Number of Pins: 3; Contact Plating: Tin,Matte; Min Operating Temperature: -55°C; Max Operating Temperature: 150°C; Packaging: Tape and Reel; Package Quantity: 3000; Drain to Source Voltage (Vdss): 8V; Continuous Drain Current (ID): 6A; Radiation Hardening: No; REACH SVHC: No SVHC; Lead Free: Lead Free; ComponentLink1URL: https://datasheet.ciiva.com/14905/si2342ds-14905257.pdf?src-supplier=Arrow; ComponentLink1Description: https://datasheet.ciiva.com/14905/si2342ds-14905257.pdf?src-supplier=Arrow; ComponentLink2URL: https://datasheet.ciiva.com/29746/si2342ds-29746581.pdf?src-supplier=Digi-Key; ComponentLink2Description: https://datasheet.ciiva.com/29746/si2342ds-29746581.pdf?src-supplier=Digi-Key; ComponentLink3URL: https://datasheet.ciiva.com/30021/si2342ds-30021814.pdf?src-supplier=Avnet; ComponentLink3Description: https://datasheet.ciiva.com/30021/si2342ds-30021814.pdf?src-supplier=Avnet